# Altium schematic sheet s3_dsp.SchDoc: Наименование
size 420 x 297 mm; ApprovedBy: Утвердил; CheckedBy: Проверил; Author: Разработал; CompanyName: ВлГУ; DrawnBy: Н.Контр; Engineer: Т.Контр; SheetNumber: 9; SheetTotal: 9; PageSetup: Record=PageOptions|CenterHorizontal=True|CenterVertical=True|PrintScale=0.94|XCorrection=1.00|YCorrection=1.00|PrintKind=1|BorderSize=5000000|LeftOffset=0|BottomOffset=0|Orientation=1|PaperLength=1000|PaperWidth=1000|Scale=100|PaperSource=7|PrintQuality=-4|MediaType=1|DitherType=10|PaperKind=A4|PrintScaleMode=1; DecimalNumber: Децимальный номер; HeadOfSector: Нач. сектора; MainDevice: Перв.примен.; Name: Наименование; DocumentName: Sheet1.SCHDOC
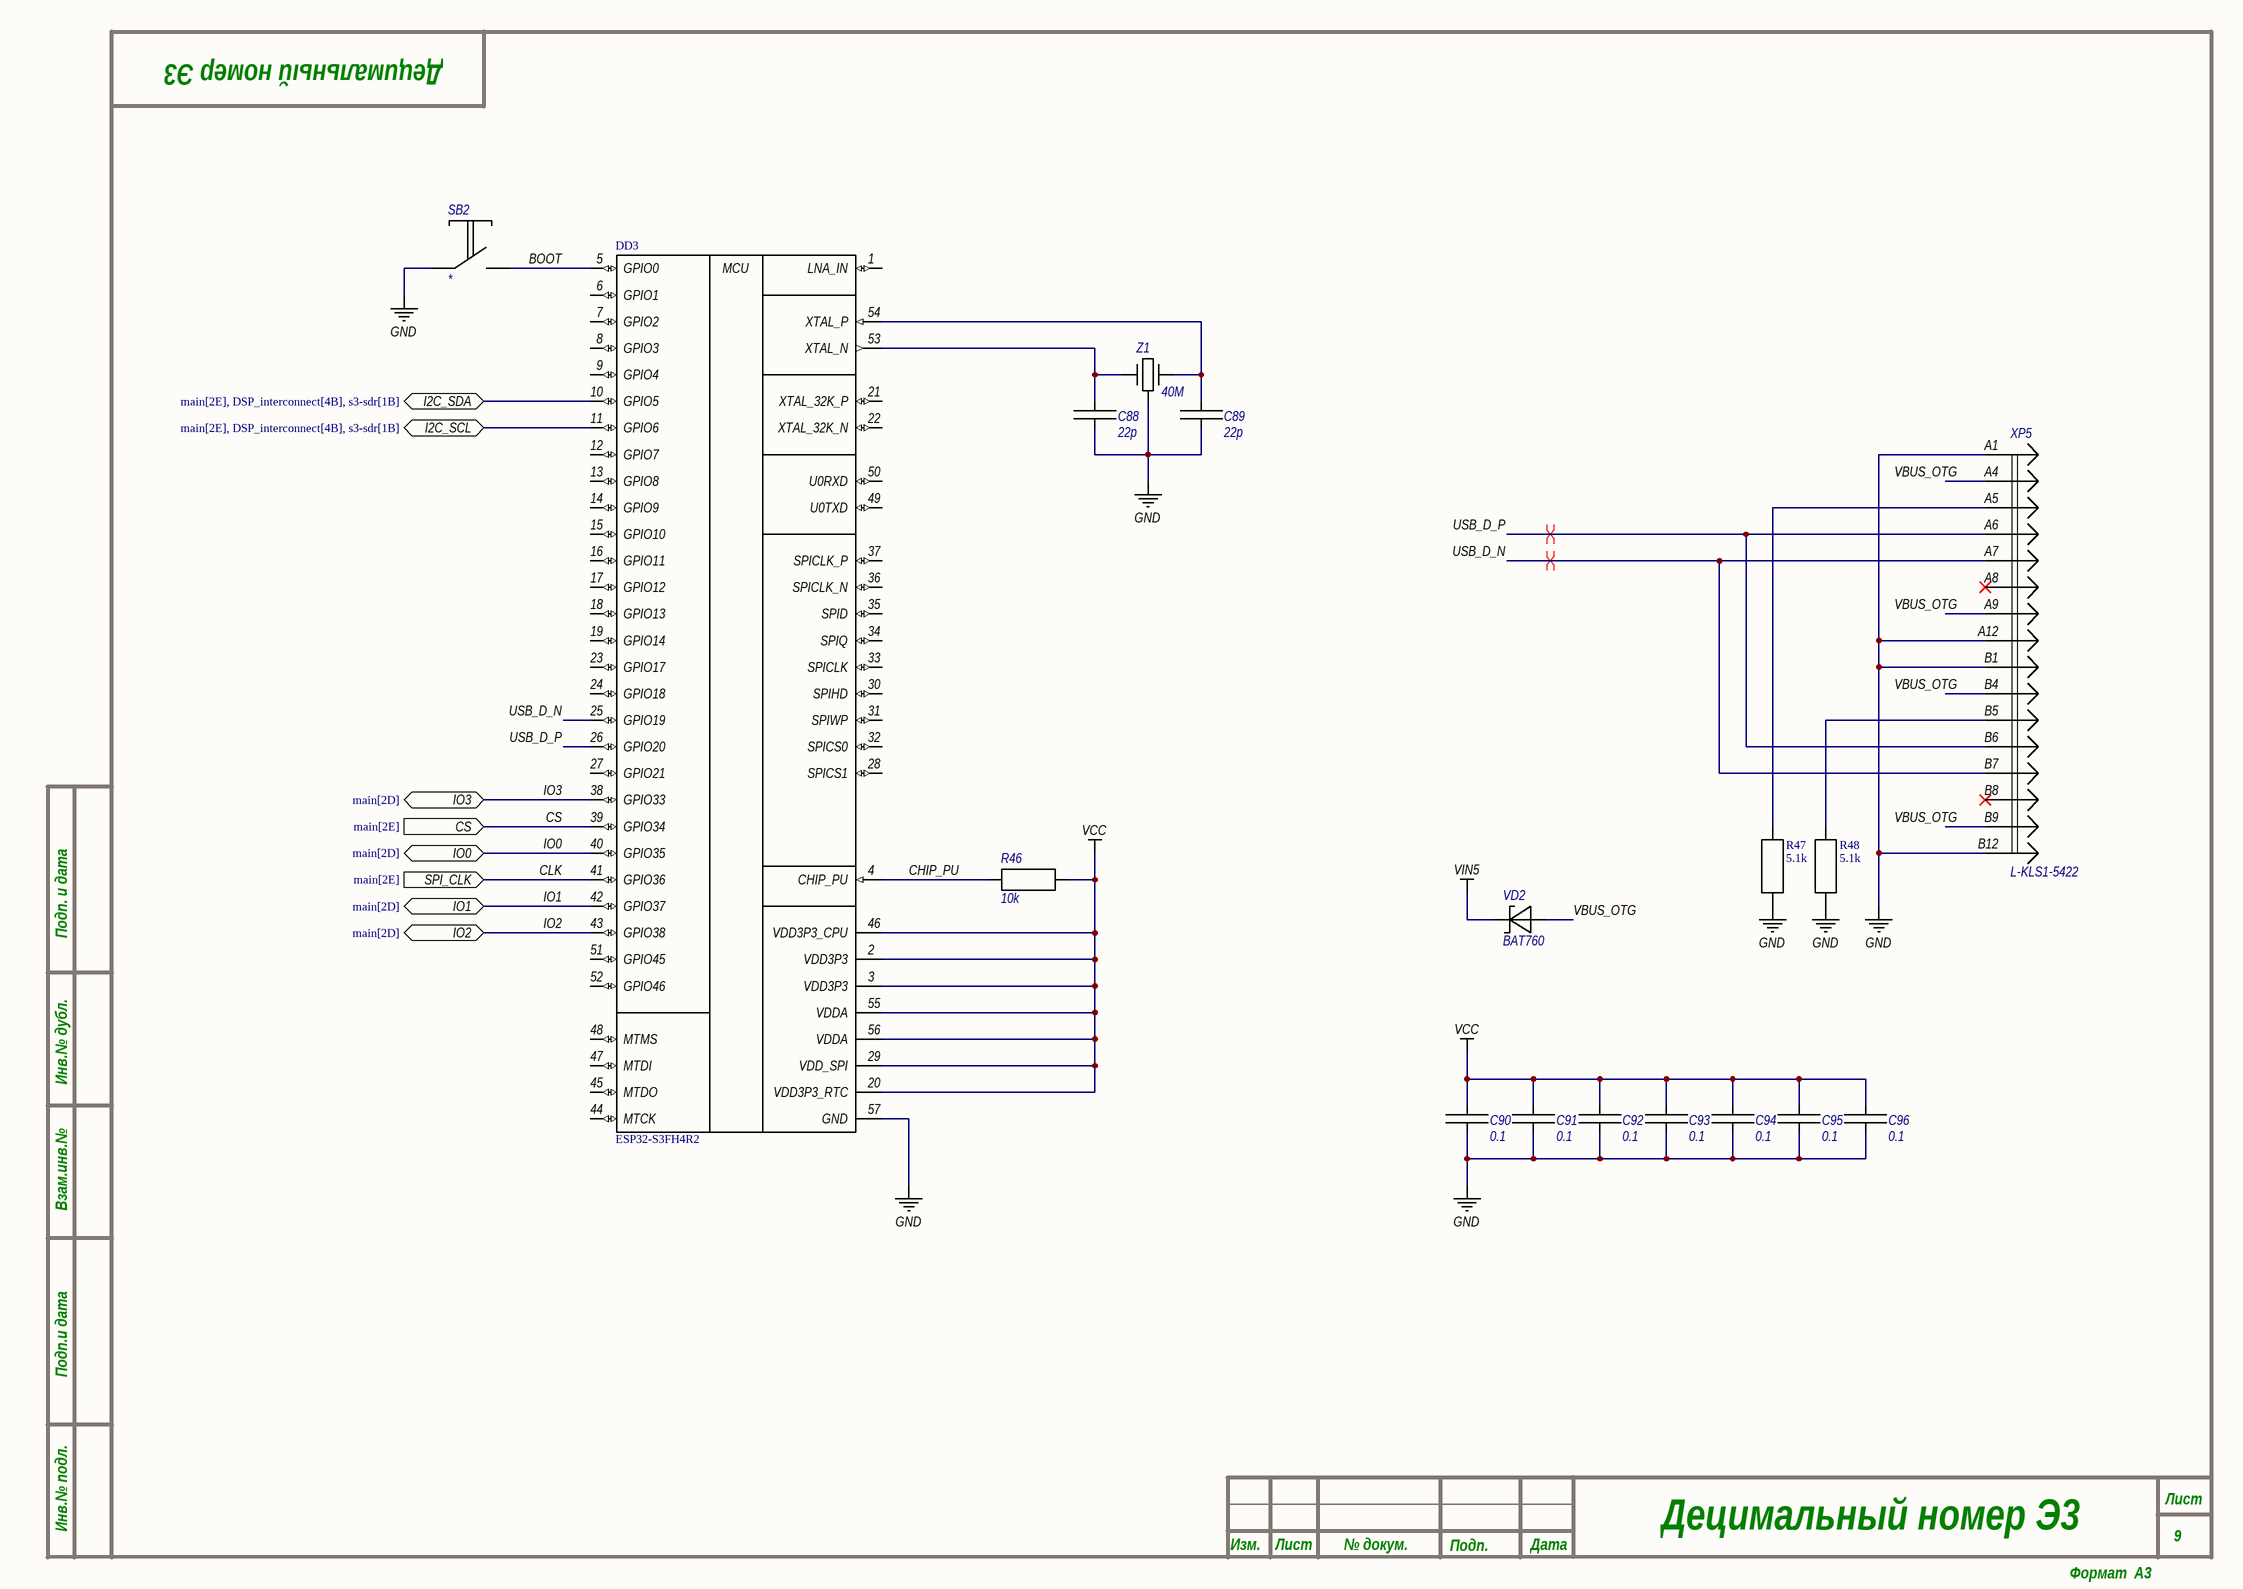
[diagram p0: s3_dsp.SchDoc]

## Parts
C88  22p  [C0603C]
C89  22p  [C0603C]
C90  0.1  [C0805C]
C91  0.1  [C0805C]
C92  0.1  [C0805C]
C93  0.1  [C0805C]
C94  0.1  [C0805C]
C95  0.1  [C0805C]
C96  0.1  [C0805C]
DD3  ESP32-S3FH4R2  [QFN56_7X7_EXP-M]
R46  10k  [C0805R]
R47  5.1k  [C0805R]
R48  5.1k  [C0805R]
SB2  *  [SW_B3U-1000P]
VD2  BAT760  [SOD123]
XP5  L-KLS1-5422  [L-KLS1-5422]
Z1  40M  [DFN170P250X90-4N]

## Ports
CS (in, see main[2E]), I2C_SCL (bidir, see main[2E], DSP_interconnect[4B], s3-sdr[1B]), I2C_SDA (bidir, see main[2E], DSP_interconnect[4B], s3-sdr[1B]), IO0 (bidir, see main[2D]), IO1 (bidir, see main[2D]), IO2 (bidir, see main[2D]), IO3 (bidir, see main[2D]), SPI_CLK (in, see main[2E])

## Nets
GND: C88.2 C89.2 C90.2 C91.2 C92.2 C93.2 C94.2 C95.2 C96.2 DD3.57(GND) R47.2 R48.2 SB2.1 XP5.A1 XP5.A12 XP5.B1 XP5.B12 Z1.2,4(E)
VCC: C90.1 C91.1 C92.1 C93.1 C94.1 C95.1 C96.1 DD3.2(VDD3P3) DD3.3(VDD3P3) DD3.20(VDD3P3_RTC) DD3.29(VDD_SPI) DD3.46(VDD3P3_CPU) DD3.55(VDDA) DD3.56(VDDA) R46.1
VIN5: VD2.C
BOOT: DD3.5(GPIO0) SB2.2
CHIP_PU: DD3.4(CHIP_PU) R46.2
CLK: DD3.41(GPIO36) ; port SPI_CLK
CS: DD3.39(GPIO34) ; port CS
I2C_SCL: DD3.11(GPIO6) ; port I2C_SCL
I2C_SDA: DD3.10(GPIO5) ; port I2C_SDA
IO0: DD3.40(GPIO35) ; port IO0
IO1: DD3.42(GPIO37) ; port IO1
IO2: DD3.43(GPIO38) ; port IO2
IO3: DD3.38(GPIO33) ; port IO3
USB_D_N: DD3.25(GPIO19) XP5.A7 XP5.B7
USB_D_P: DD3.26(GPIO20) XP5.A6 XP5.B6
VBUS_OTG: VD2.A XP5.A4 XP5.A9 XP5.B4 XP5.B9
NetC88_1: C88.1 DD3.53(XTAL_N) Z1.1(OSC1)
NetC89_1: C89.1 DD3.54(XTAL_P) Z1.3(OSC2)
NetR47_1: R47.1 XP5.A5
NetR48_1: R48.1 XP5.B5

Not connected (* = marked no-connect by the designer): DD3 1(LNA_IN) 6(GPIO1) 7(GPIO2) 8(GPIO3) 9(GPIO4) 12(GPIO7) 13(GPIO8) 14(GPIO9) 15(GPIO10) 16(GPIO11) 17(GPIO12) 18(GPIO13) 19(GPIO14) 21(XTAL_32K_P) 22(XTAL_32K_N) 23(GPIO17) 24(GPIO18) 27(GPIO21) 28(SPICS1) 30(SPIHD) 31(SPIWP) 32(SPICS0) 33(SPICLK) 34(SPIQ) 35(SPID) 36(SPICLK_N) 37(SPICLK_P) 44(MTCK) 45(MTDO) 47(MTDI) 48(MTMS) 49(U0TXD) 50(U0RXD) 51(GPIO45) 52(GPIO46); XP5 A8* B8*

## Layout directives
differential pair: USB_D_N, USB_D_P

## Notes on the sheet
- Подп. и дата
- Инв.№ дубл.
- Взам.инв.№
- Подп.и дата
- Инв.№ подл.
- Изм.
- Лист
- № докум.
- Подп.
- Дата
- Формат  A3
- (in symbol ESP32-S3) MCU

## Library data of the parts
C88-C96 = Cap
  C88 C89: Value: 22p
  C90-C96: Value: 0.1
DD3 = ESP32-S3: Description; Manufacturer_Name: Espressif Systems; Copyright: Copyright (C) 2025 Ultra Librarian. All rights reserved.; Manufacturer_Part_Number: ESP32-S3; RefDes: RefDes; Type: Type
R46 = res: Value: 10k
R47 R48 = res: MAPPING: 2(1,2,100)(1,2,100); Value: 5.1k; TYPE: Resistor
SB2 = SW-PB: Part number: *
VD2 = Shotktky Diode: Part number: BAT760
XP5 = L-KLS1-5422: Стандарт USB 3.1 , Тип стандарта Type C , Монтаж На плату, SMD , Тип разъема Розетка , Количество портов 1 , Расположение контактов Прямое; Part number: L-KLS1-5422
Z1 = XTALE: Value: 40M